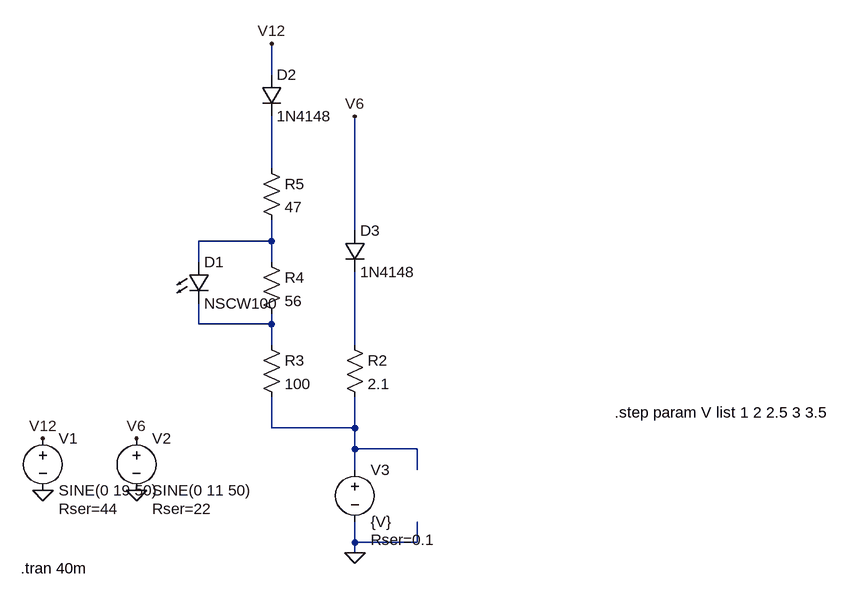
[diagram p0: schematic energizer_battery_charger.asc]
energizer_battery_charger.asc, the LTspice schematic file:
Version 4
SHEET 1 1364 680
WIRE 352 -496 352 -544
WIRE 352 -352 352 -432
WIRE 480 -256 480 -432
WIRE 352 -240 352 -272
WIRE 352 -240 240 -240
WIRE 240 -208 240 -240
WIRE 352 -208 352 -240
WIRE 240 -112 240 -144
WIRE 352 -112 352 -128
WIRE 352 -112 240 -112
WIRE 352 -80 352 -112
WIRE 480 -80 480 -192
WIRE 352 48 352 0
WIRE 480 48 480 0
WIRE 480 48 352 48
WIRE 480 80 480 48
WIRE 576 80 480 80
WIRE 480 112 480 80
WIRE 576 112 576 80
WIRE 480 224 480 192
WIRE 576 224 576 192
WIRE 576 224 480 224
WIRE 480 240 480 224
FLAG 0 144 0
FLAG 144 144 0
FLAG 480 240 0
FLAG 0 64 V12
FLAG 144 64 V6
FLAG 480 -432 V6
FLAG 352 -544 V12
SYMBOL voltage 0 48 R0
WINDOW 123 0 0 Left 0
WINDOW 39 24 124 Left 2
SYMATTR InstName V1
SYMATTR Value SINE(0 19 50)
SYMATTR SpiceLine Rser=44
SYMBOL voltage 144 48 R0
WINDOW 123 0 0 Left 0
WINDOW 39 24 124 Left 2
SYMATTR InstName V2
SYMATTR Value SINE(0 11 50)
SYMATTR SpiceLine Rser=22
SYMBOL res 464 -96 R0
SYMATTR InstName R2
SYMATTR Value 2.1
SYMBOL res 336 -96 R0
SYMATTR InstName R3
SYMATTR Value 100
SYMBOL res 336 -224 R0
SYMATTR InstName R4
SYMATTR Value 56
SYMBOL res 336 -368 R0
SYMATTR InstName R5
SYMATTR Value 47
SYMBOL LED 224 -208 R0
SYMATTR InstName D1
SYMATTR Value NSCW100
SYMATTR Description Diode
SYMATTR Type diode
SYMBOL diode 336 -496 R0
SYMATTR InstName D2
SYMATTR Value 1N4148
SYMBOL diode 464 -256 R0
SYMATTR InstName D3
SYMATTR Value 1N4148
SYMBOL voltage 480 96 R0
WINDOW 123 0 0 Left 0
WINDOW 39 24 124 Left 2
SYMATTR InstName V3
SYMATTR Value {V}
SYMATTR SpiceLine Rser=0.1
TEXT -34 264 Left 2 !.tran 40m
TEXT 880 24 Left 2 !.step param V list 1 2 2.5 3 3.5

The netlist it stands for:
* energizer_battery_charger.asc
V1 V12 0 SINE(0 19 50) Rser=44
V2 V6 0 SINE(0 11 50) Rser=22
R2 N004 N005 2.1
R3 N003 N005 100
R4 N002 N003 56
R5 N001 N002 47
D1 N002 N003 NSCW100
D2 V12 N001 1N4148
D3 V6 N004 1N4148
V3 N005 0 {V} Rser=0.1
.model D D
.lib standard.dio
.tran 40m
.step param V list 1 2 2.5 3 3.5
.backanno
.end